# Altium schematic sheet Sheet1.SchDoc: Type C - USB 3.0 Li-Po Charger and Regulator
size A1; SheetNumber: 1; SheetTotal: 1
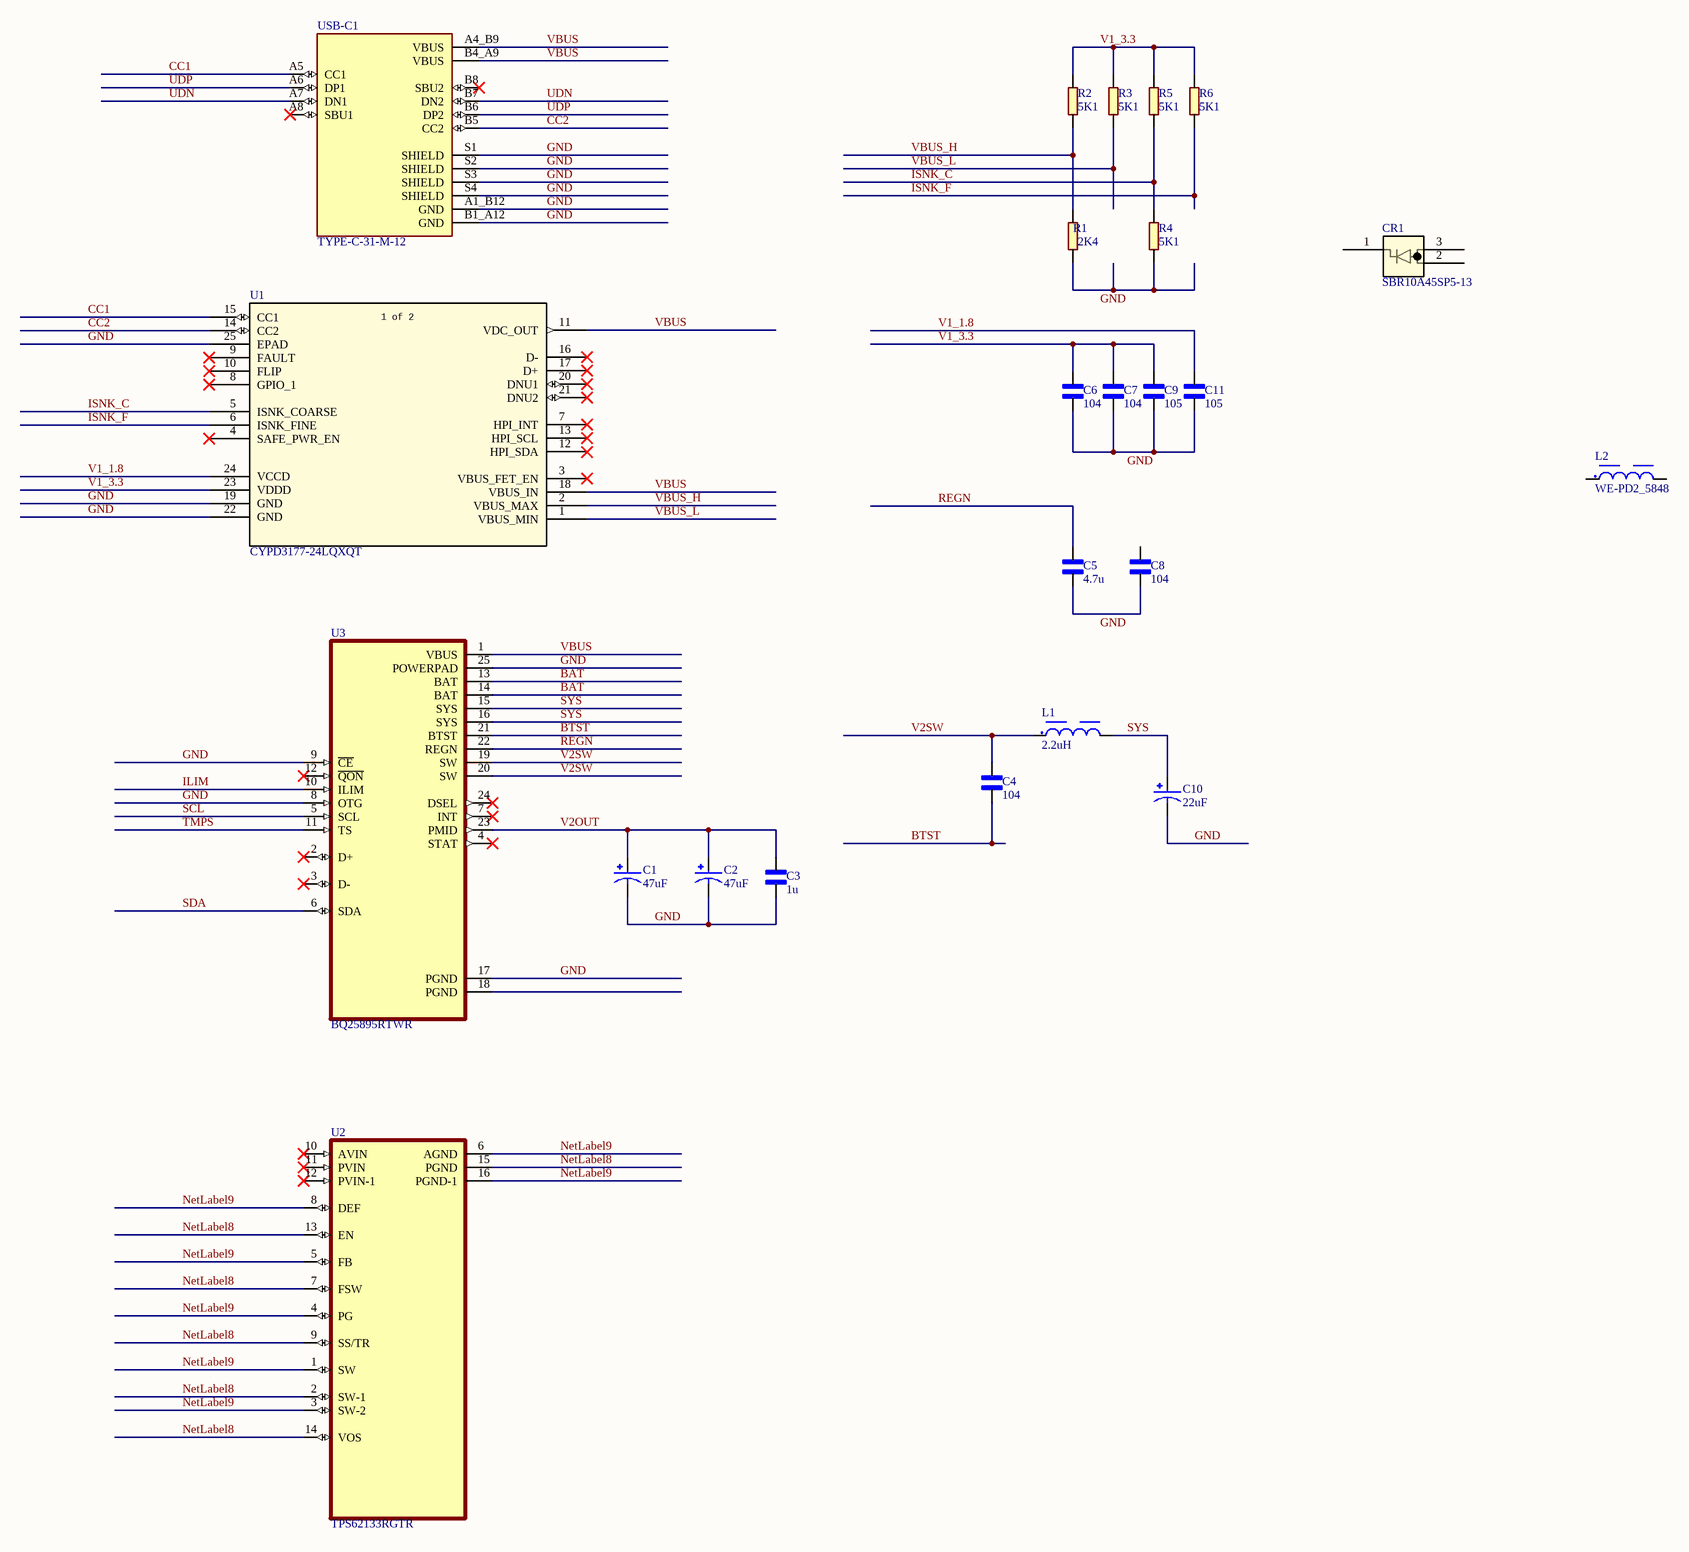
[diagram p0: Sheet1.SchDoc]

## Parts
C1  47uF  [CAP_EEEFN1C220R]
C2  47uF  [CAP_EEEFN1C220R]
C3  1u  [CAPC2012X88N]
C4  104  [CAPC3216X110N]
C5  4.7u  [CAPC3216X110N]
C6  104  [CAPC2012X88N]
C7  104  [CAPC2012X88N]
C8  104  [CAPC3216X110N]
C9  105  [CAPC2012X88N]
C10  22uF  [CAP_EEEFN1C220R]
C11  105  [CAPC2012X88N]
CR1  SBR10A45SP5-13  [POWERDI5_DIO]
L1  2.2uH  [WE-PD2_5848]
L2  WE-PD2_5848  [WE-PD2_5848]
R1  2K4  [0603]
R2  5K1  [0603]
R3  5K1  [0603]
R4  5K1  [0603]
R5  5K1  [0603]
R6  5K1  [0603]
U1  CYPD3177-24LQXQT  [QFN24_CYPD3177-24LQXQT_INF]
U2  TPS62133RGTR  [QFN50P300X300X100-17N]
U3  BQ25895RTWR  [QFN50P400X400X80-25N]
USB-C1  TYPE-C-31-M-12  [HRO_TYPE-C-31-M-12]

## Nets
\: C1.2 C2.2 C3.2 C5.2 C6.2 C7.2 C8.2 C9.2 C10.2 C11.2 R1.1 R4.1 U1.19(GND) U1.22(GND) U1.25(EPAD) U3.8(OTG) U3.9(~{CE}) U3.17(PGND) U3.18(PGND) U3.25(POWERPAD) USB-C1.A1_B12(GND) USB-C1.B1_A12(GND) USB-C1.S1(SHIELD) USB-C1.S2(SHIELD) USB-C1.S3(SHIELD) USB-C1.S4(SHIELD)  [also labelled GND]
BAT: U3.13(BAT) U3.14(BAT)
BTST: C4.1 U3.21(BTST)
CC1: U1.15(CC1) USB-C1.A5(CC1)
CC2: U1.14(CC2) USB-C1.B5(CC2)
ILIM: U3.10(ILIM)
ISNK_C: R4.2 R5.1 U1.5(ISNK_COARSE)
ISNK_F: R6.1 U1.6(ISNK_FINE)
NetLabel8: U2.2(SW-1) U2.7(FSW) U2.9(SS/TR) U2.13(EN) U2.14(VOS) U2.15(PGND)
NetLabel9: U2.1(SW) U2.3(SW-2) U2.4(PG) U2.5(FB) U2.6(AGND) U2.8(DEF) U2.16(PGND-1)
REGN: C5.1 U3.22(REGN)
SCL: U3.5(SCL)
SDA: U3.6(SDA)
SYS: C10.1 L1.2 U3.15(SYS) U3.16(SYS)
TMPS: U3.11(TS)
UDN: USB-C1.A7(DN1) USB-C1.B7(DN2)
UDP: USB-C1.A6(DP1) USB-C1.B6(DP2)
V1_1.8: C11.1 U1.24(VCCD)
V1_3.3: C6.1 C7.1 C9.1 R2.2 R3.2 R5.2 R6.2 U1.23(VDDD)
V2OUT: C1.1 C2.1 C3.1 U3.23(PMID)
V2SW: C4.2 L1.1 U3.19(SW) U3.20(SW)
VBUS: U1.11(VDC_OUT) U1.18(VBUS_IN) U3.1(VBUS) USB-C1.A4_B9(VBUS) USB-C1.B4_A9(VBUS)
VBUS_H: R1.2 R2.1 U1.2(VBUS_MAX)
VBUS_L: R3.1 U1.1(VBUS_MIN)

Not connected (* = marked no-connect by the designer): C8 1; CR1 1(CATHODE) 2(ANODE) 3(ANODE); L2 1 2; U1 3(VBUS_FET_EN)* 4(SAFE_PWR_EN)* 7(HPI_INT)* 8(GPIO_1)* 9(FAULT)* 10(FLIP)* 12(HPI_SDA)* 13(HPI_SCL)* 16(D-)* 17(D+)* 20(DNU1)* 21(DNU2)*; U2 10(AVIN)* 11(PVIN)* 12(PVIN-1)*; U3 2(D+)* 3(D-)* 4(STAT)* 7(INT)* 12(~{QON})* 24(DSEL)*; USB-C1 A8(SBU1)* B8(SBU2)*

## Notes on the sheet
- (in symbol CYPD3177-24LQXQT) 1 of 2

## Library data of the parts
C1 C2 C10 = EEEFN1C220R: CAP ALUM 22UF 20% 16V SMD; MF: Panasonic Electronic Components; MP: EEE-FN1C220R; Package: RADIAL-2 Panasonic; Value: *; Price: None; Check_prices: https://www.snapeda.com/parts/EEE-FN1C220R/Panasonic/view-part/6178704/?ref=eda; Purchase-URL: https://pricing.snapeda.com/search/part/EEE-FN1C220R/?ref=eda; Availability: In Stock; SnapEDA_Link: https://www.snapeda.com/parts/EEE-FN1C220R/Panasonic/view-part/6178704/?ref=snap
C3 C6 C7 C9 C11 = C0805F104K5RACTU: 0805 C 100nF Ceramic Multilayer Capacitor, 50 VDC, +125degC, X7R Dielec, +/-10% | KEMET C0805F104K5RACTU; SnapEDA_Link: https://www.snapeda.com/parts/C0805F104K5RACTU/KEMET/view-part/?ref=snap; Package: 0805 Kemet; Value: *; MF: KEMET; MP: C0805F104K5RACTU; Check_prices: https://www.snapeda.com/parts/C0805F104K5RACTU/KEMET/view-part/?ref=eda
C4 C5 C8 = C1206C475K5RACTU: 4.7 ÂµF Â±10% 50V Ceramic Capacitor X7R 1206 (3216 Metric); MF: KEMET; SnapEDA_Link: https://www.snapeda.com/parts/C1206C475K5RACTU/KEMET/view-part/?ref=snap; Package: 1206-2 KEMET; Value: *; MP: C1206C475K5RACTU; Check_prices: https://www.snapeda.com/parts/C1206C475K5RACTU/KEMET/view-part/?ref=eda
CR1 = SBR10A45SP5-13: No Description Available; Manufacturer_Name: Diodes Inc; Copyright: Copyright (C) 2026 Ultra Librarian. All rights reserved.; Manufacturer_Part_Number: SBR10A45SP5-13; RefDes: RefDes; Type: Type
L1 L2 = WE-PD2_5848: 2.2 ÂµH Unshielded Drum Core, Wirewound Inductor 4.6 A 41mOhm Max Nonstandard; MF: WÃ¼rth Elektronik; MP: 744774022; SnapEDA_Link: https://www.snapeda.com/parts/744774022/W%25C3%25BCrth+Elektronik+Midcom/view-part/?ref=snap; Package: Nonstandard Wurth Electronics; Value: *; Check_prices: https://www.snapeda.com/parts/744774022/W%25C3%25BCrth+Elektronik+Midcom/view-part/?ref=eda
R1-R6 = RT0603BRD0710KL: 10 kOhms Â±0.1% 0.1W, 1/10W Chip Resistor 0603 (1608 Metric) - Thin Film; MF: Yageo; SnapEDA_Link: https://www.snapeda.com/parts/RT0603BRD0710KL/Yageo/view-part/?ref=snap; Package: SMD-2 Yageo; Value: *; MP: RT0603BRD0710KL; Check_prices: https://www.snapeda.com/parts/RT0603BRD0710KL/Yageo/view-part/?ref=eda
U1 = CYPD3177-24LQXQT: EZ-PDâ„¢ Barrel Connector Replacement (BCR) CYPD3177-24LQXQT is the tape and reel packing type option of EZ-PDâ„¢ BCR family, the highly-integrated USB Type-C port controllers for power sink applications. It targets electronic devices using legacy barrel connectors up to 100 W or USB micro-B for power inputs, enabling product designers to replace these incompatible connectors with USB-C.EZ-PDâ„¢ BCR complies with USB Type-C and USB 3.0 Power Delivery (PD) standards and enables users to quickly convert their devices from being powered through a barrel connector to being powered via the USB-C connector with few external components and no firmware development is required. It integrates a complete USB Type-C transceiver, USB PD policy manager, a load switch controller with a soft start, all termination resistors required for a USB Type-C port, and system-level ESD protection. It is available in a 24-pin QFN package.; Manufacturer_Name: Infineon; Copyright: Copyright (C) 2026 Ultra Librarian. All rights reserved.; Manufacturer_Part_Number: CYPD3177-24LQXQT; RefDes: RefDes; Type: Type
U2 = TPS62133RGTR: 3-17V 3A Step-Down Converter in 3x3 QFN Package; MF: Texas Instruments; SnapEDA_Link: https://www.snapeda.com/parts/TPS62133RGTR/Texas+Instruments/view-part/?ref=snap; Package: VQFN-16 Texas Instruments; Value: *; MP: TPS62133RGTR; Check_prices: https://www.snapeda.com/parts/TPS62133RGTR/Texas+Instruments/view-part/?ref=eda
U3 = BQ25895RTWR: I2C 1cell 5A buck battery charger with high input voltage and 3.1-A boost with HVDCP enabled; MF: Texas Instruments; SnapEDA_Link: https://www.snapeda.com/parts/BQ25895RTWR/Texas+Instruments/view-part/?ref=snap; Package: WQFN-24 Texas Instruments; Value: *; MP: BQ25895RTWR; Check_prices: https://www.snapeda.com/parts/BQ25895RTWR/Texas+Instruments/view-part/?ref=eda
USB-C1 = TYPE-C-31-M-12: USB Connectors 24 Receptacle 1 8.94*7.3mm RoHS; MF: HRO Electronics Co., Ltd.; SnapEDA_Link: https://www.snapeda.com/parts/TYPE-C-31-M-12/HRO+Electronics+Co.%252C+Ltd./view-part/?ref=snap; Package: Package; Value: *; MP: TYPE-C-31-M-12; Check_prices: https://www.snapeda.com/parts/TYPE-C-31-M-12/HRO+Electronics+Co.%252C+Ltd./view-part/?ref=eda